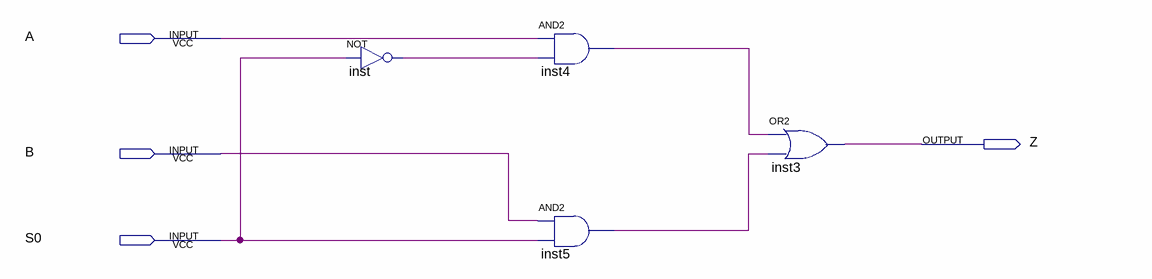
[diagram p0: schematic sheet]
// Quartus schematic Mux2_1.bdf as structural Verilog: 4 symbols, 4 pins
module Mux2_1 (
  input  A,
  input  B,
  input  S0,
  output Z
);

  wire inst4_out, inst5_out, inst_out;

  not inst (inst_out, S0);
  and inst4 (inst4_out, A, inst_out);
  and inst5 (inst5_out, B, S0);
  or inst3 (Z, inst4_out, inst5_out);
endmodule
